# Altium schematic sheet Top-Sheet.SchDoc
size A4; SheetNumber: 1; SheetTotal: 10
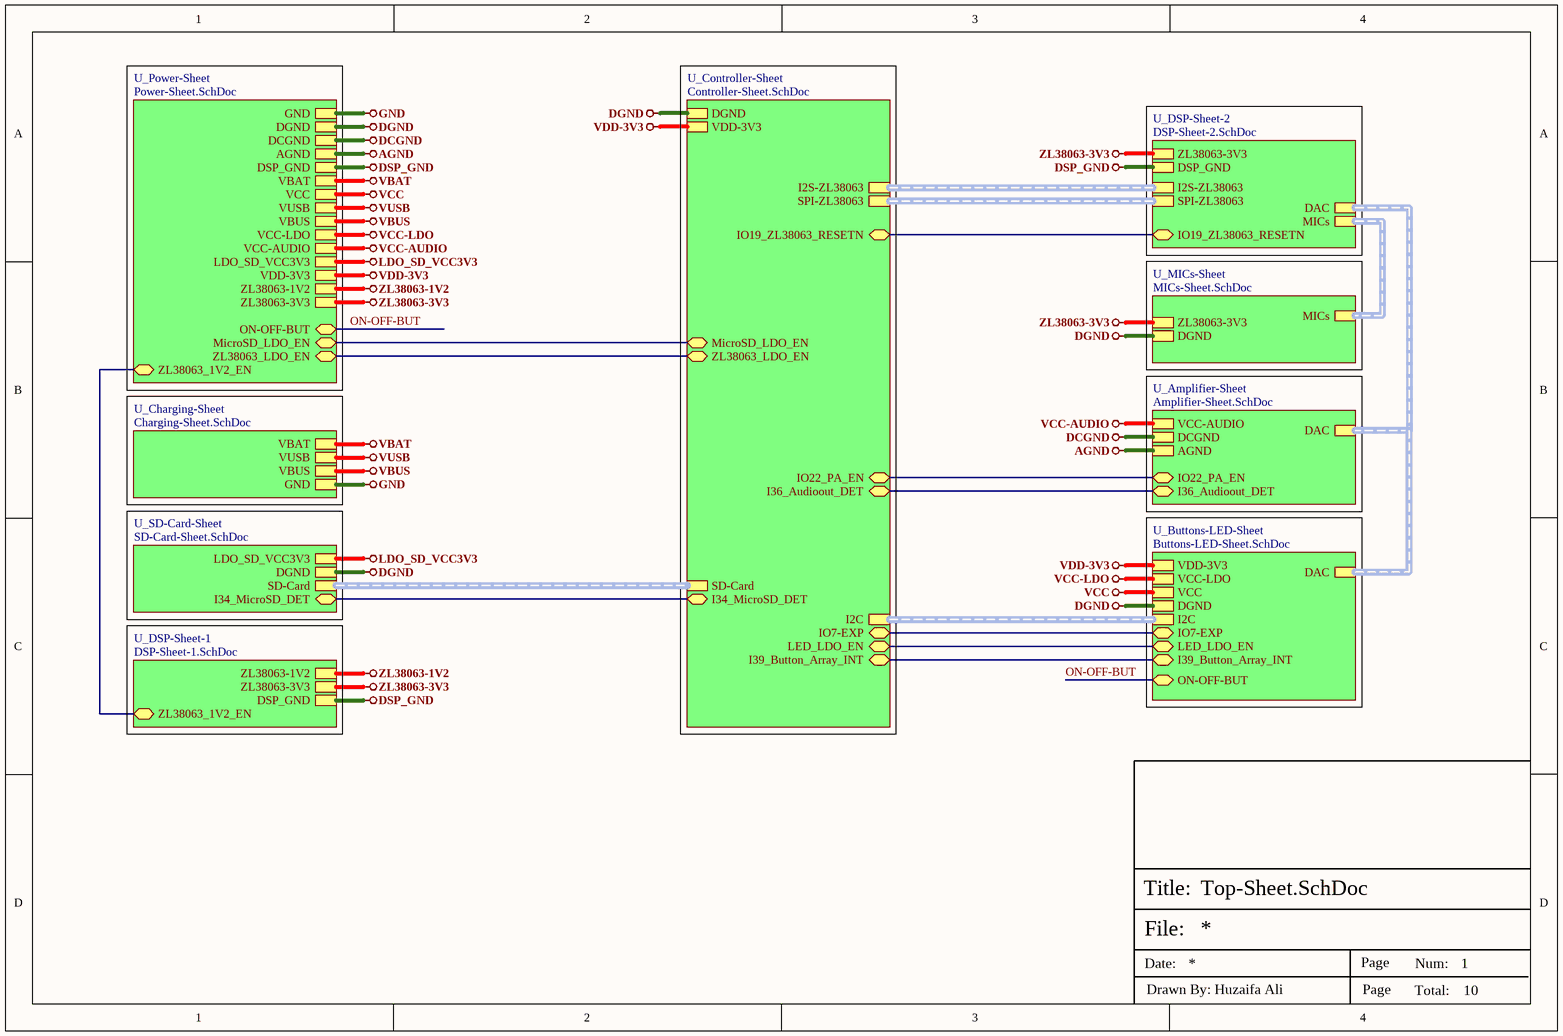
[diagram p0: Top-Sheet.SchDoc]

## Sub-sheets
U_Amplifier-Sheet = Amplifier-Sheet.SchDoc: DAC (harness DAC), VCC-AUDIO, DCGND, IO22_PA_EN (bidir), AGND, I36_Audioout_DET (bidir)
U_Buttons-LED-Sheet = Buttons-LED-Sheet.SchDoc: ON-OFF-BUT (bidir), DGND, VDD-3V3, I39_Button_Array_INT (bidir), I2C (harness I2C), IO7-EXP (bidir), VCC-LDO, DAC (harness DAC), LED_LDO_EN (bidir), VCC
U_Charging-Sheet = Charging-Sheet.SchDoc: VBAT, VUSB, VBUS, GND
U_Controller-Sheet = Controller-Sheet.SchDoc: DGND, VDD-3V3, I2S-ZL38063 (harness I2S-ZL38063), SPI-ZL38063 (harness SPI-ZL38063), I2C (harness I2C), SD-Card (harness SD-Card), IO19_ZL38063_RESETN (bidir), IO22_PA_EN (bidir), I34_MicroSD_DET (bidir), I36_Audioout_DET (bidir), I39_Button_Array_INT (bidir), ZL38063_LDO_EN (bidir), MicroSD_LDO_EN (bidir), IO7-EXP (bidir), LED_LDO_EN (bidir)
U_DSP-Sheet-1 = DSP-Sheet-1.SchDoc: ZL38063-1V2, ZL38063-3V3, DSP_GND, ZL38063_1V2_EN (bidir)
U_DSP-Sheet-2 = DSP-Sheet-2.SchDoc: I2S-ZL38063 (harness I2S-ZL38063), SPI-ZL38063 (harness SPI-ZL38063), ZL38063-3V3, DSP_GND, MICs (harness MICs), DAC (harness DAC), IO19_ZL38063_RESETN (bidir)
U_MICs-Sheet = MICs-Sheet.SchDoc: MICs (harness MICs), ZL38063-3V3, DGND
U_Power-Sheet = Power-Sheet.SchDoc: GND, VCC-AUDIO, DGND, VBAT, VCC-LDO, VUSB, VBUS, ZL38063-1V2, ZL38063-3V3, LDO_SD_VCC3V3, VDD-3V3, DCGND, AGND, DSP_GND, ON-OFF-BUT (bidir), MicroSD_LDO_EN (bidir), ZL38063_LDO_EN (bidir), ZL38063_1V2_EN (bidir), VCC
U_SD-Card-Sheet = SD-Card-Sheet.SchDoc: SD-Card (harness SD-Card), DGND, LDO_SD_VCC3V3, I34_MicroSD_DET (bidir)

## Nets
AGND: sheet U_Power-Sheet/AGND, sheet U_Amplifier-Sheet/AGND
DCGND: sheet U_Power-Sheet/DCGND, sheet U_Amplifier-Sheet/DCGND
DGND: sheet U_Power-Sheet/DGND, sheet U_Controller-Sheet/DGND, sheet U_MICs-Sheet/DGND, sheet U_SD-Card-Sheet/DGND, sheet U_Buttons-LED-Sheet/DGND
DSP_GND: sheet U_Power-Sheet/DSP_GND, sheet U_DSP-Sheet-1/DSP_GND, sheet U_DSP-Sheet-2/DSP_GND
GND: sheet U_Power-Sheet/GND, sheet U_Charging-Sheet/GND
LDO_SD_VCC3V3: sheet U_Power-Sheet/LDO_SD_VCC3V3, sheet U_SD-Card-Sheet/LDO_SD_VCC3V3
VBAT: sheet U_Power-Sheet/VBAT, sheet U_Charging-Sheet/VBAT
VBUS: sheet U_Power-Sheet/VBUS, sheet U_Charging-Sheet/VBUS
VCC: sheet U_Power-Sheet/VCC, sheet U_Buttons-LED-Sheet/VCC
VCC-AUDIO: sheet U_Power-Sheet/VCC-AUDIO, sheet U_Amplifier-Sheet/VCC-AUDIO
VCC-LDO: sheet U_Power-Sheet/VCC-LDO, sheet U_Buttons-LED-Sheet/VCC-LDO
VDD-3V3: sheet U_Power-Sheet/VDD-3V3, sheet U_Controller-Sheet/VDD-3V3, sheet U_Buttons-LED-Sheet/VDD-3V3
VUSB: sheet U_Power-Sheet/VUSB, sheet U_Charging-Sheet/VUSB
ZL38063-1V2: sheet U_Power-Sheet/ZL38063-1V2, sheet U_DSP-Sheet-1/ZL38063-1V2
ZL38063-3V3: sheet U_Power-Sheet/ZL38063-3V3, sheet U_DSP-Sheet-1/ZL38063-3V3, sheet U_DSP-Sheet-2/ZL38063-3V3, sheet U_MICs-Sheet/ZL38063-3V3
ON-OFF-BUT: sheet U_Power-Sheet/ON-OFF-BUT, sheet U_Buttons-LED-Sheet/ON-OFF-BUT
(unnamed): sheet U_Power-Sheet/MicroSD_LDO_EN, sheet U_Controller-Sheet/MicroSD_LDO_EN
(unnamed): sheet U_Power-Sheet/ZL38063_LDO_EN, sheet U_Controller-Sheet/ZL38063_LDO_EN
(unnamed): sheet U_Power-Sheet/ZL38063_1V2_EN, sheet U_DSP-Sheet-1/ZL38063_1V2_EN
(unnamed): sheet U_Controller-Sheet/IO19_ZL38063_RESETN, sheet U_DSP-Sheet-2/IO19_ZL38063_RESETN
(unnamed): sheet U_Controller-Sheet/IO22_PA_EN, sheet U_Amplifier-Sheet/IO22_PA_EN
(unnamed): sheet U_Controller-Sheet/I34_MicroSD_DET, sheet U_SD-Card-Sheet/I34_MicroSD_DET
(unnamed): sheet U_Controller-Sheet/I36_Audioout_DET, sheet U_Amplifier-Sheet/I36_Audioout_DET
(unnamed): sheet U_Controller-Sheet/I39_Button_Array_INT, sheet U_Buttons-LED-Sheet/I39_Button_Array_INT
(unnamed): sheet U_Controller-Sheet/IO7-EXP, sheet U_Buttons-LED-Sheet/IO7-EXP
(unnamed): sheet U_Controller-Sheet/LED_LDO_EN, sheet U_Buttons-LED-Sheet/LED_LDO_EN

## Buses and harness runs
harness sheet U_Amplifier-Sheet/DAC = sheet U_Buttons-LED-Sheet/DAC = sheet U_DSP-Sheet-2/DAC
harness sheet U_Buttons-LED-Sheet/I2C = sheet U_Controller-Sheet/I2C
harness sheet U_Controller-Sheet/I2S-ZL38063 = sheet U_DSP-Sheet-2/I2S-ZL38063
harness sheet U_Controller-Sheet/SD-Card = sheet U_SD-Card-Sheet/SD-Card
harness sheet U_Controller-Sheet/SPI-ZL38063 = sheet U_DSP-Sheet-2/SPI-ZL38063
harness sheet U_DSP-Sheet-2/MICs = sheet U_MICs-Sheet/MICs

## Notes on the sheet
- File:
- Title:
- Date:
- Page
- Num:
- Total:
- Drawn By: Huzaifa Ali